# Altium schematic sheet MD040_Motor_Driver_RevE2.SchDoc
size 431 x 279 mm; Date: Not shown in title block; ApprovedBy: Not shown in title block; CheckedBy: Not shown in title block; Author: Not shown in title block; CompanyName: Not shown in title block; Engineer: Not shown in title block; Organization: Not shown in title block; Address1: Not shown in title block; Address2: Not shown in title block; Address3: Not shown in title block; Address4: Not shown in title block; DocumentNumber: 2; Revision: Use project parameter SCH_Rev; SheetNumber: 2; SheetTotal: 3; PageSetup: Record=PageOptions|CenterHorizontal=True|CenterVertical=True|PrintScale=1.00|XCorrection=1.00|YCorrection=1.00|PrintKind=0|BorderSize=5000000|LeftOffset=0|BottomOffset=0|Orientation=2|PaperLength=1000|PaperWidth=1000|Scale=100|PaperSource=15|PrintQuality=600|MediaType=1|DitherType=10|PaperKind=Letter|PrintScaleMode=1; CurrentTime: Not shown in title block; CurrentDate: Not shown in title block; Time: Not shown in title block; DocumentFullPathAndName: Not shown in title block; DocumentName: Not shown in title block; ModifiedDate: Not shown in title block; ImagePath: Not shown in title block
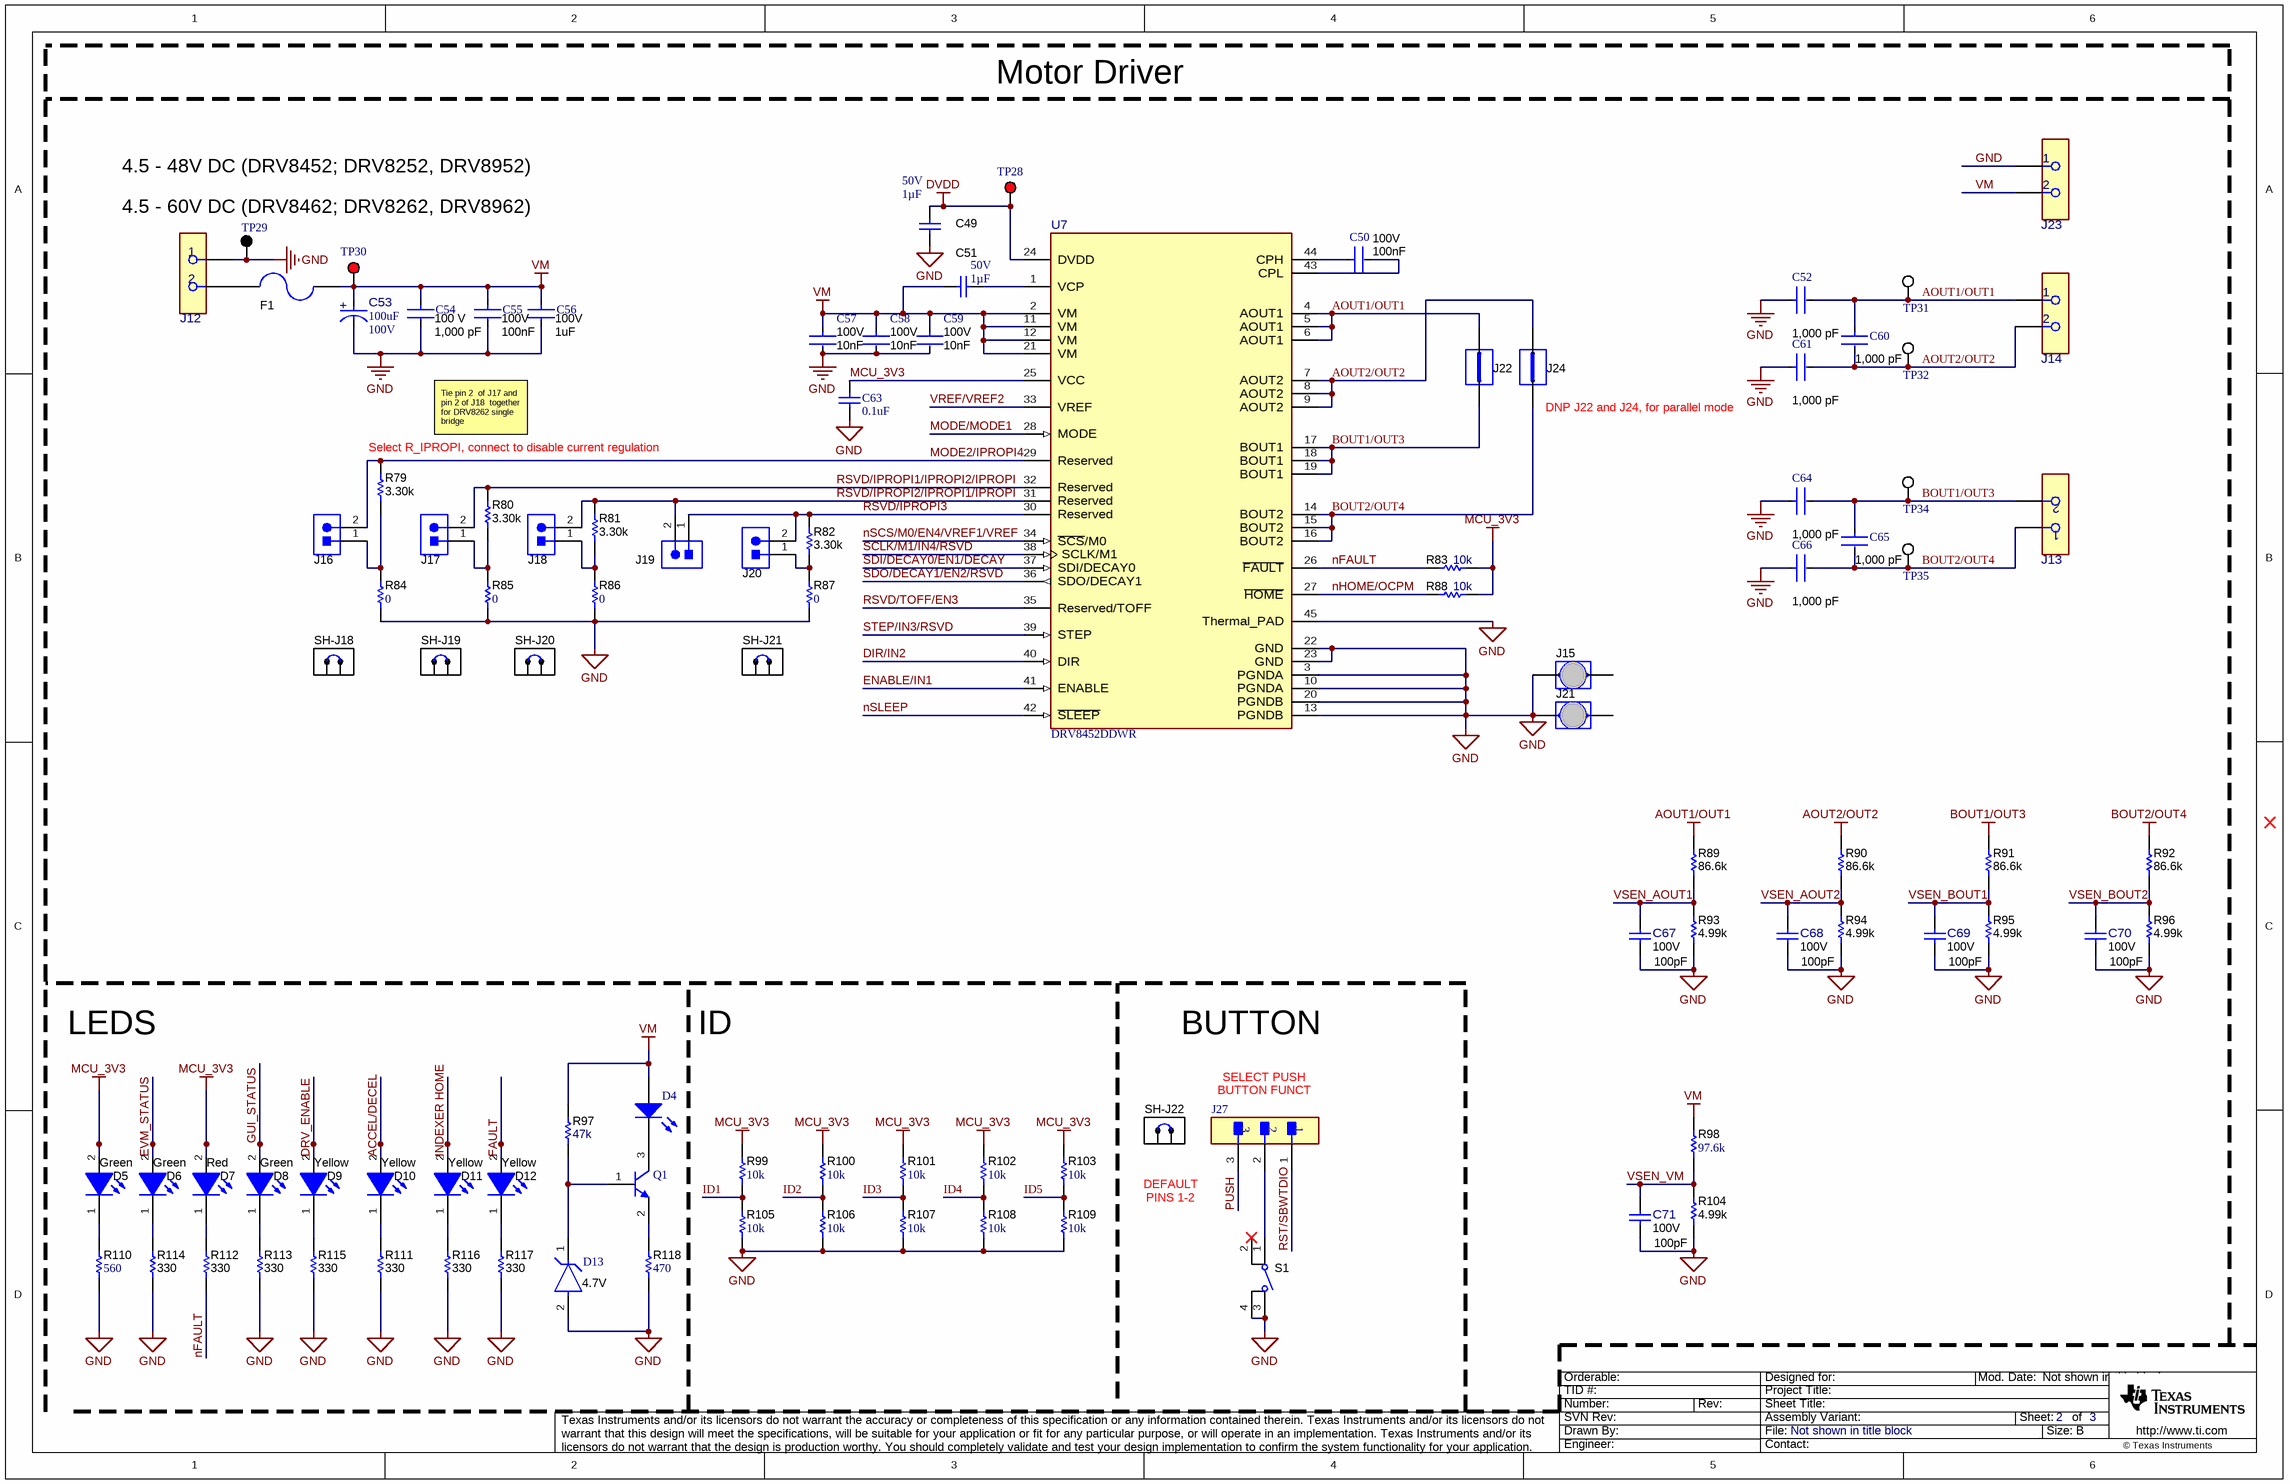
[diagram p0: MD040_Motor_Driver_RevE2.SchDoc]

## Parts
C49  Cap_F: 1µF  VDC_V: 50V  [0805_HV]  (hidden comment: C2012X7R1H105K125AB)
C50  Voltage Rating: 100V  Capacitance: 100nF  [FP-0603-L_1_6_0_1-W_0_8_0-IPC_B]  (hidden comment: HMK107BJ104MA-T)
C51  Cap_F: 1µF  VDC_V: 50V  [0805_HV]  (hidden comment: C2012X7R1H105K125AB)
C52  value 1,000 pF  [FP-C0603C-CF-MFG]  (hidden comment: C0603C102K1RACAUTO)
C53  ValueDisplayed: 100uF  VDC_V: 100V  [FP-EMVY101ARA101MKE0S_RADIAL-MFG]  (hidden comment: EMVY101ARA101MKE0S)
C54  value 1,000 pF  Voltage Rating: 100 V  [FP-C0603C-CF-MFG]  (hidden comment: C0603C102K1RACAUTO)
C55  Voltage Rating: 100V  Capacitance: 100nF  [FP-0603-L_1_6_0_1-W_0_8_0-IPC_B]  (hidden comment: HMK107BJ104MA-T)
C56  value 1uF  Voltage Rating: 100V  [FP-GRM21-0_2-MFG]  (hidden comment: GRM21BC72A105KE01L)
C57  Voltage Rating: 100V  Capacitance: 10nF  [FP-0603-L_1_6_0_1-W_0_8_0-IPC_A]  (hidden comment: HMK107B7103MA-T)
C58  Voltage Rating: 100V  Capacitance: 10nF  [FP-0603-L_1_6_0_1-W_0_8_0-IPC_A]  (hidden comment: HMK107B7103MA-T)
C59  Voltage Rating: 100V  Capacitance: 10nF  [FP-0603-L_1_6_0_1-W_0_8_0-IPC_A]  (hidden comment: HMK107B7103MA-T)
C60  value 1,000 pF  [FP-C0603C-CF-MFG]  (hidden comment: C0603C102K1RACAUTO)
C61  value 1,000 pF  [FP-C0603C-CF-MFG]  (hidden comment: C0603C102K1RACAUTO)
C63  0.1uF  [CAPC0603(1608)100_L]
C64  value 1,000 pF  [FP-C0603C-CF-MFG]  (hidden comment: C0603C102K1RACAUTO)
C65  value 1,000 pF  [FP-C0603C-CF-MFG]  (hidden comment: C0603C102K1RACAUTO)
C66  value 1,000 pF  [FP-C0603C-CF-MFG]  (hidden comment: C0603C102K1RACAUTO)
C67  VDC_V: 100V  Cap_F: 100pF  [FP-C0402C101J1HAC_0402-IPC_B]  (hidden comment: C0402C101J1HACTU)
C68  VDC_V: 100V  Cap_F: 100pF  [FP-C0402C101J1HAC_0402-IPC_B]  (hidden comment: C0402C101J1HACTU)
C69  VDC_V: 100V  Cap_F: 100pF  [FP-C0402C101J1HAC_0402-IPC_B]  (hidden comment: C0402C101J1HACTU)
C70  VDC_V: 100V  Cap_F: 100pF  [FP-C0402C101J1HAC_0402-IPC_B]  (hidden comment: C0402C101J1HACTU)
C71  VDC_V: 100V  Cap_F: 100pF  [FP-C0402C101J1HAC_0402-IPC_B]  (hidden comment: C0402C101J1HACTU)
D4  150060SS75000  [0603_A]  (value not drawn)
D5  value Green  [WL-SMCW_GREEN]  (hidden comment: 150060VS75000)
D6  value Green  [WL-SMCW_GREEN]  (hidden comment: 150060VS75000)
D7  value Red  [WL-SMCW_RED]  (hidden comment: 150060SS75000)
D8  value Green  [WL-SMCW_GREEN]  (hidden comment: 150060VS75000)
D9  value Yellow  [WL-SMCW_YELLOW]  (hidden comment: 150060YS75000)
D10  value Yellow  [WL-SMCW_YELLOW]  (hidden comment: 150060YS75000)
D11  value Yellow  [WL-SMCW_YELLOW]  (hidden comment: 150060YS75000)
D12  value Yellow  [WL-SMCW_YELLOW]  (hidden comment: 150060YS75000)
D13  Nom Zener Voltage: 4.7V  [FP-SOD323F-MFG]  (hidden comment: BZX84J-B4V7,115)
F1  0463015.ER  [Fuse_0463]  (value not drawn)
J12  691256610002  [FP-691256610002_HDR2-MFG]  (value not drawn)
J13  691250610002  [FP-691250610002_CONN_TERM_BLOCK2-MFG]  (value not drawn)
J14  691250610002  [FP-691250610002_CONN_TERM_BLOCK2-MFG]  (value not drawn)
J15  D3082-05  [Harwin_D3082-05]  (value not drawn)
J16  PBC02SAAN  [Sullins_PBC02SAAN]  (value not drawn)
J17  PBC02SAAN  [Sullins_PBC02SAAN]  (value not drawn)
J18  PBC02SAAN  [Sullins_PBC02SAAN]  (value not drawn)
J19  PBC02SAAN  [Sullins_PBC02SAAN]  (value not drawn)
J20  PBC02SAAN  [Sullins_PBC02SAAN]  (value not drawn)
J21  D3082-05  [Harwin_D3082-05]  (value not drawn)
J22  D3082-05  [Harwin_D3082-05]  (value not drawn)
J23  691250610002  [FP-691250610002_CONN_TERM_BLOCK2-MFG]  (value not drawn)
J24  D3082-05  [Harwin_D3082-05]  (value not drawn)
J27  PR20203VBNN  [FP-PR20203VBNN-MFG]  (value not drawn)
Q1  BC846BLT1G  [ONSC-SOT-23-3-318-08_V]  (value not drawn)
R79  ValueDisplayed: 3.30k  [0402L]  (hidden comment: ERJ-2RKF3301X)
R80  ValueDisplayed: 3.30k  [0402L]  (hidden comment: ERJ-2RKF3301X)
R81  ValueDisplayed: 3.30k  [0402L]  (hidden comment: ERJ-2RKF3301X)
R82  ValueDisplayed: 3.30k  [0402L]  (hidden comment: ERJ-2RKF3301X)
R83  ValueDisplayed: 10k  [0603L]  (hidden comment: RC0603JR-0710KL)
R84  ValueDisplayed: 0  [0402]  (hidden comment: CRCW04020000Z0EDHP)
R85  ValueDisplayed: 0  [0402]  (hidden comment: CRCW04020000Z0EDHP)
R86  ValueDisplayed: 0  [0402]  (hidden comment: CRCW04020000Z0EDHP)
R87  ValueDisplayed: 0  [0402]  (hidden comment: CRCW04020000Z0EDHP)
R88  ValueDisplayed: 10k  [0603L]  (hidden comment: RC0603JR-0710KL)
R89  ValueDisplayed: 86.6k  [0603L]  (hidden comment: CRCW060386K6FKEA)
R90  ValueDisplayed: 86.6k  [0603L]  (hidden comment: CRCW060386K6FKEA)
R91  ValueDisplayed: 86.6k  [0603L]  (hidden comment: CRCW060386K6FKEA)
R92  ValueDisplayed: 86.6k  [0603L]  (hidden comment: CRCW060386K6FKEA)
R93  ValueDisplayed: 4.99k  [0603L]  (hidden comment: CRCW06034K99FKEA)
R94  ValueDisplayed: 4.99k  [0603L]  (hidden comment: CRCW06034K99FKEA)
R95  ValueDisplayed: 4.99k  [0603L]  (hidden comment: CRCW06034K99FKEA)
R96  ValueDisplayed: 4.99k  [0603L]  (hidden comment: CRCW06034K99FKEA)
R97  ValueDisplayed: 47k  [0402]  (hidden comment: CRCW040247K0JNED)
R98  ValueDisplayed: 97.6k  [0603]  (hidden comment: RT0603DRE0797K6L)
R99  ValueDisplayed: 10k  [0603L]  (hidden comment: RC0603JR-0710KL)
R100  ValueDisplayed: 10k  [0603L]  (hidden comment: RC0603JR-0710KL)
R101  ValueDisplayed: 10k  [0603L]  (hidden comment: RC0603JR-0710KL)
R102  ValueDisplayed: 10k  [0603L]  (hidden comment: RC0603JR-0710KL)
R103  ValueDisplayed: 10k  [0603L]  (hidden comment: RC0603JR-0710KL)
R104  ValueDisplayed: 4.99k  [0603L]  (hidden comment: CRCW06034K99FKEA)
R105  ValueDisplayed: 10k  [0603L]  (hidden comment: RC0603JR-0710KL)
R106  ValueDisplayed: 10k  [0603L]  (hidden comment: RC0603JR-0710KL)
R107  ValueDisplayed: 10k  [0603L]  (hidden comment: RC0603JR-0710KL)
R108  ValueDisplayed: 10k  [0603L]  (hidden comment: RC0603JR-0710KL)
R109  ValueDisplayed: 10k  [0603L]  (hidden comment: RC0603JR-0710KL)
R110  ValueDisplayed: 560  [0603]  (hidden comment: RC0603FR-07560RL)
R111  ValueDisplayed: 330  [0603L]  (hidden comment: CMP-0025785-4)
R112  ValueDisplayed: 330  [0603L]  (hidden comment: CMP-0025785-4)
R113  ValueDisplayed: 330  [0603L]  (hidden comment: CMP-0025785-4)
R114  ValueDisplayed: 330  [0603L]  (hidden comment: CMP-0025785-4)
R115  ValueDisplayed: 330  [0603L]  (hidden comment: CMP-0025785-4)
R116  ValueDisplayed: 330  [0603L]  (hidden comment: CMP-0025785-4)
R117  ValueDisplayed: 330  [0603L]  (hidden comment: CMP-0025785-4)
R118  ValueDisplayed: 470  [0603]  (hidden comment: RC0603FR-07470RL)
S1  FSM4JSMA  [SW_FSM4JSMA]  (value not drawn)
SH-J18  SNT-100-BK-G  [SNT-100-BK-G]  (value not drawn)
SH-J19  SNT-100-BK-G  [SNT-100-BK-G]  (value not drawn)
SH-J20  SNT-100-BK-G  [SNT-100-BK-G]  (value not drawn)
SH-J21  SNT-100-BK-G  [SNT-100-BK-G]  (value not drawn)
SH-J22  SNT-100-BK-G  [SNT-100-BK-G]  (value not drawn)
TP28  5010  [Keystone5010]  (value not drawn)
TP29  5011  [Keystone5011]  (value not drawn)
TP30  5010  [Keystone5010]  (value not drawn)
TP31  5015  [Testpoint_Keystone_Miniature]  (value not drawn)
TP32  5015  [Testpoint_Keystone_Miniature]  (value not drawn)
TP34  5015  [Testpoint_Keystone_Miniature]  (value not drawn)
TP35  5015  [Testpoint_Keystone_Miniature]  (value not drawn)
U7  DRV8452DDWR  [DDW0044E-MFG]

## Nets
AOUT1/OUT1: C52.2 C60.1 J14.1 J22.2 R89.2 TP31.1 U7.4(AOUT1) U7.5(AOUT1) U7.6(AOUT1)
AOUT2/OUT2: C60.2 C61.2 J14.2 J24.2 R90.2 TP32.1 U7.7(AOUT2) U7.8(AOUT2) U7.9(AOUT2)
BOUT1/OUT3: C64.2 C65.1 J13.2 J22.1 R91.2 TP34.1 U7.17(BOUT1) U7.18(BOUT1) U7.19(BOUT1)
BOUT2/OUT4: C65.2 C66.2 J13.1 J24.1 R92.2 TP35.1 U7.14(BOUT2) U7.15(BOUT2) U7.16(BOUT2)
DVDD: C49.1 TP28.1 U7.24(DVDD)
GND: C49.2 C52.1 C53.1(CATHODE) C54.2 C55.2 C56.2 C57.2 C58.2 C59.2 C61.1 C63.1 C64.1 C66.1 C67.2 C68.2 C69.2 C70.2 C71.2 D13.2(A) J12.1 J15.1 J21.1 J23.1 R84.1 R85.1 R86.1 R87.1 R93.1 R94.1 R95.1 R96.1 R104.1 R105.2 R106.2 R107.2 R108.2 R109.2 R110.1 R111.1 R113.1 R114.1 R115.1 R116.1 R117.1 R118.1 S1.3 S1.4 TP29.1 U7.3(PGNDA) U7.10(PGNDA) U7.13(PGNDB) U7.20(PGNDB) U7.22(GND) U7.23(GND) U7.45(Thermal_PAD)
MCU_3V3: C63.2 D5.2(A) D7.2(A) R83.2 R88.2 R99.1 R100.1 R101.1 R102.1 R103.1 U7.25(VCC)
VM: C51.1 C53.2(ANODE) C54.1 C55.1 C56.1 C57.1 C58.1 C59.1 D4.2(A) F1.1 J23.2 R97.2 R98.2 TP30.1 U7.2(VM) U7.11(VM) U7.12(VM) U7.21(VM)
ACCEL/DECEL: D10.2(A)
DIR/IN2: U7.40(DIR)
DRV_ENABLE: D9.2(A)
ENABLE/IN1: U7.41(ENABLE)
EVM_STATUS: D6.2(A)
FAULT: D12.2(A)
GUI_STATUS: D8.2(A)
ID1: R99.2 R105.1
ID2: R100.2 R106.1
ID3: R101.2 R107.1
ID4: R102.2 R108.1
ID5: R103.2 R109.1
INDEXER HOME: D11.2(A)
MODE2/IPROPI4: J16.2 R79.2 U7.29(Reserved)
MODE/MODE1: U7.28(MODE)
nFAULT: R83.1 R112.1 U7.26(~{FAULT})
nHOME/OCPM: R88.1 U7.27(~{HOME})
nSCS/M0/EN4/VREF1/VREF: U7.34(~{SCS}/M0)
nSLEEP: U7.42(~{SLEEP})
PUSH: J27.3
RST/SBWTDIO: J27.1
RSVD/IPROPI1/IPROPI2/IPROPI: J17.2 R80.2 U7.32(Reserved)
RSVD/IPROPI2/IPROPI1/IPROPI: J18.2 J19.2 R81.2 U7.31(Reserved)
RSVD/IPROPI3: J19.1 J20.2 R82.2 U7.30(Reserved)
RSVD/TOFF/EN3: U7.35(Reserved/TOFF)
SCLK/M1/IN4/RSVD: U7.38(SCLK/M1)
SDI/DECAY0/EN1/DECAY: U7.37(SDI/DECAY0)
SDO/DECAY1/EN2/RSVD: U7.36(SDO/DECAY1)
STEP/IN3/RSVD: U7.39(STEP)
VREF/VREF2: U7.33(VREF)
VSEN_AOUT1: C67.1 R89.1 R93.2
VSEN_AOUT2: C68.1 R90.1 R94.2
VSEN_BOUT1: C69.1 R91.1 R95.2
VSEN_BOUT2: C70.1 R92.1 R96.2
VSEN_VM: C71.1 R98.1 R104.2
NetC50_1: C50.1 U7.44(CPH)
NetC50_2: C50.2 U7.43(CPL)
NetC51_2: C51.2 U7.1(VCP)
NetD4_1: D4.1(K) Q1.3(C)
NetD5_1: D5.1(K) R110.2
NetD6_1: D6.1(K) R114.2
NetD7_1: D7.1(K) R112.2
NetD8_1: D8.1(K) R113.2
NetD9_1: D9.1(K) R115.2
NetD10_1: D10.1(K) R111.2
NetD11_1: D11.1(K) R116.2
NetD12_1: D12.1(K) R117.2
NetD13_1: D13.1(C) Q1.1(B) R97.1
NetF1_2: F1.2 J12.2
NetJ16_1: J16.1 R79.1 R84.2
NetJ17_1: J17.1 R80.1 R85.2
NetJ18_1: J18.1 R81.1 R86.2
NetJ20_1: J20.1 R82.1 R87.2
NetJ27_2: J27.2 S1.1
NetQ1_2: Q1.2(E) R118.2

Not connected (* = marked no-connect by the designer): J15 2; J21 2; S1 2*

## Notes on the sheet
- Motor Driver
- 4.5 - 48V DC (DRV8452; DRV8252, DRV8952)
- 4.5 - 60V DC (DRV8462; DRV8262, DRV8962)
- Tie pin 2  of J17 and pin 2 of J18  together for DRV8262 single bridge
- (near J24) DNP J22 and J24, for parallel mode
- (near R79) Select R_IPROPI, connect to disable current regulation
- LEDS
- ID
- BUTTON
- SELECT PUSH
- BUTTON FUNCT
- DEFAULT
- PINS 1-2
- Drawn By:
- SVN Rev:
- Number:
- TID #:
- Orderable:
- Rev:
- Sheet Title:
- File:
- Project Title:
- Designed for:
- Assembly Variant:
- Mod. Date:
- Sheet:
- Size:
- of
- B
- http://www.ti.com
- Texas Instruments and/or its licensors do not warrant the accuracy or completeness of this specification or any information contained therein. Texas Instruments and/or its licensors do not warrant that this design will meet the specifications, will be suitable for your application or fit for any particular purpose, or will operate in an implementation. Texas Instruments and/or its licensors do not warrant that the design is production worthy. You should completely validate and test your design implementation to confirm the system functionality for your application.
- Engineer:
- Contact:
- © Texas Instruments
- (in symbol CMP-0094051-1) +

## Library data of the parts
C49 C51 = CMP-0007873-2: CAP, CERM, 1 uF, 50 V, +/- 10%, X7R, 0805; Manufacturer: TDK; TaMin_C: -55°C; ESR_ohm: 8.782m; Polarized: N; SizeAreaWB_mm2: 6.75; Value1: 0.008782 ohm; U/M: EA; Value: 1uF; TaMax_C: 125°C; SizeZ_mm: 1.45; SizeX_mm: 2; SizeY_mm: 1.25; Cap_Case: 0805; SizeArea_mm2: 2.5; IRMS_A: 2.2049A; AEC Category: Q200; Supplier Part Number 2: 810-C2012X7R1H105K; Publisher: Texas Instruments; Supplier 2: Mouser; TempCo: X7R; Published: 2008-06-19; RoHS: Y; MountType: SMT; Supplier 1: Digi-Key; PackageReference: 0805; Tolerance_%: 10%; Value2: 50V; CompType: Capacitor; LatestRevisionDate: 2017-03-09; PartNumber: C2012X7R1H105K125AB; AEC Qualified: N; ComponentLink1Description: Datasheet link; AEC Grade: N/A; Supplier Part Number 1: 445-7547-1-ND; Technology: Ceramic; ValueDisplayed: 1uF; ComponentLink1URL: https://product.tdk.com/en/search/capacitor/ceramic/mlcc/info?part_no=C2012X7R1H105K125AB
C50 C55 = CMP-14477-003474-1: Ceramic Capacitor General Use 0.1uF ±20% 100V X5R 0603; Mount: Surface Mount; Dielectric: X5R; Tolerance: 20%; Radiation Hardening: No; Max Operating Temperature: 85°C; RoHS Compliant: Yes; Depth: 0.8mm; Halogen Free: Halogen Free; Case/Package: Ceramic; Thickness: 0.035inch; Width: 0.031inch; Lead Free: Lead Free; Packaging: Tape and Reel; Min Operating Temperature: -55°C; Voltage Rating (DC): 100V; Length: 1.6mm
C52 C54 C60 C61 C64-C66 = CMP-2006-03016-2: CAP CER 1000PF 100V X7R 0603; Manufacturer: KEMET; Material: Ceramic; Automotive Grade: Grade 1; Temperature Coefficient: 30ppm/°C; Tolerance: 0.1; Category: Cap; ComponentLink2Description: Datasheet; Temperature: -55°C to +125°C; Height: 0.87mm; Octopart: https://octopart.com/c0603c102k1racauto-kemet-12573995; Package: C0603C-CF; Automotive: Yes; Digikey Description: CAP CER 1000PF 100V X7R 0603; Temperature Characteristic: X7R; Device Class L3: Ceramic Capacitors; Temperature Range High: +125°C; RoHS: TRUE; Capacitance: 1,000 pF; Device Class L1: Passive Components; Lead Free: Yes; Mouser Description: Multilayer Ceramic Capacitors MLCC - SMD/SMT 1000pF 100volts 10% X7R AUTO; Manufacturer Part Number: C0603C102K1RACAUTO; ComponentLink2URL: https://api.kemet.com/component-edge/download/datasheet/C0603C100J5GACAUTO.pdf; Temperature Range Low: -55°C; Device Class L2: Capacitors
  C52 C60 C61 C64-C66: Voltage Rating: 100 V
C53 = CMP-0094051-1: 100uF 100V 20% Aluminum Electrolytic Capacitors Radial, Can - SMD - 5000 Hrs @ 105°C; Manufacturer: United Chemi-Con; Value: 100µF; IRMS_A: 450mA; Life: 5000Hours; SizeZ_mm: 14mm; AEC Grade: Grade 2; Leakage Current: 100uA; Dissipation Factor: 10%; AEC Qualified: Yes; Tolerance_%: 20%; Supplier 1: Digikey; helpURL: https://upverter.com/upn/revision/452647827c621875/; Lead Free: Yes; Part Number: EMVY101ARA101MKE0S; Supplier Part Number 1: 565-2511-1-ND; PartNumber: EMVY101ARA101MKE0S; Cap_F: 100µF; ComponentLink1Description: Datasheet; Digikey Part Number: 565-2511-1-ND; Datasheet Path: datasheets/Cap-EMVY101ARA101MKE0S.pdf; RoHS: TRUE; Mouser Description: Cap Aluminum Lytic 100uF 100V 20% (12.5 X 13.5mm) SMD 450mA 5000h 105C Automotive T/R; ComponentLink1URL: https://www.chemi-con.co.jp/products/relatedfiles/capacitor/catalog/MVYRA-e.PDF; Operating Temperature Range: -40°C to +105°C; PackageReference: RADIAL; datasheet: https://www.chemi-con.co.jp/products/relatedfiles/capacitor/catalog/MVYRA-e.PDF; Digikey Description: CAP ALUM 100UF 20% 100V SMD; Mouser Part Number: 661-EMVY101ARA101MKE; Supplier Part Number 2: 661-EMVY101ARA101MKE; Supplier 2: Mouser
C56 = CMP-06035-000063-1: CAP CER 1UF 100V X7S 0805; Manufacturer: Murata; Tolerance: 10%; Material: Ceramic; Temperature Coefficient: 22%; Automotive: No; RoHS: TRUE; Temperature Range Low: -55°C; Device Class L2: Capacitors; Capacitance: 1uF; Device Class L1: Passive Components; Temperature: -55°C to +125°C; Manufacturer Part Number: GRM21BC72A105KE01L; Digikey Description: CAP CER 1UF 100V X7S 0805; ComponentLink2URL: https://search.murata.co.jp/Ceramy/image/img/A01X/G101/ENG/GRM21BC72A105KE01-01A.pdf; Octopart: https://octopart.com/grm21bc72a105ke01l-murata-71014565; Lead Free: Yes; Category: Cap; Height: 1.45mm; Device Class L3: Ceramic Capacitors; Package: GRM21-0.2; Ipc Land Pattern Name: CAPC200125X125; Temperature Characteristic: X7S; ComponentLink2Description: Datasheet; Temperature Range High: +125°C
C57-C59 = CMP-14477-001102-1: Ceramic Capacitor General Use 0.01uF ±20% 100V X7R 0603; Thickness: 0.035inch; RoHS Compliant: Yes; Max Operating Temperature: 125°C; Mount: Surface Mount; Tolerance: 20%; Width: 0.031inch; Packaging: Tape and Reel; Min Operating Temperature: -55°C; Length: 0.063inch; Case/Package: 0603
C63 = CMP-1035-02591-1: CAP 100nF 50V ±5% 0603 (1608 Metric) Thickness 1mm SMD; Tolerance: Â±5%; Case-Metric: 1608; Case-EIA: 0603; Rated Voltage: 50 V; Max Thickness: 1 mm; Technology: SMT; Value: 100nF
C67-C71 = CMP-0087080-2: CAP CER 100PF 100V X8R 0402; Manufacturer: Kemet; AEC Qualified: No; TempCo: 15%; SizeZ_mm: 0.55mm; Tolerance_%: 5%; AEC Grade: NA; Symbol Name: SYM-C0402C101J1HAC; ComponentLink1Description: Datasheet; ComponentLink1URL: https://content.kemet.com/datasheets/KEM_C1007_X8R_ULTRA_150C_SMD.pdf; PackageReference: 0402; RoHS: TRUE; PartNumber: C0402C101J1HACTU
D4 = CMP-1426-00004-1: SMD mono-color Chip LED, WL-SMCW, Super Red; Manufacturer: Wuerth Elektronik; PartNumber: 150060SS75000; ComponentLink2URL: http://katalog.we-online.com/led/datasheet/150060SS75000.pdf; ComponentLink2Description: Datasheet; PackageReference: 0603_A; ComponentLink1Description: Manufacturer URL; ComponentLink1URL: http://www.we-online.com; Color: Super Red
D5 D6 D8 = CMP-0002894-2: LED, Green, SMD; Manufacturer: Wurth Elektronik; Type: AlInGaP; Value2: 2V; Io_A: 20mA; Value1: W; ComponentLink1Description: Datasheet link; PackageReference: LED_0603; PartNumber: 150060VS75000; ComponentLink1URL: http://katalog.we-online.de/led/datasheet/150060VS75000.pdf; Color: green; RoHS: Y; MountType: SMT; CompType: LED; Vf_V: 2V
D7 = CMP-0002893-1: LED, Super Red, SMD; Manufacturer: Wurth Elektronik; Io_A: 20mA; Value1: W; U/M: EA; Vf_V: 1.9V; Type: AlInGaP; PartNumber: 150060SS75000; PackageReference: LED_0603; ComponentLink1Description: Datasheet link; ComponentLink1URL: http://katalog.we-online.de/led/datasheet/150060SS75000.pdf; Color: super red; Supplier Part Number 2: 95W3796; Publisher: Texas Instruments; Supplier 2: Newark; Supplier Part Number 3: 2322072; Supplier 3: Farnell; Published: 2008-07-11; RoHS: Y; MountType: SMT; Supplier 1: Digi-Key; Value2: 1.9V; CompType: LED; LatestRevisionDate: 2017-03-09; Supplier Part Number 1: 732-4979-1-ND
D9 = CMP-0002892-3: LED, Yellow, SMD; Manufacturer: Wurth Elektronik; Value1: W; Vf_V: 2V; Type: AlInGaP; Io_A: 20mA; PartNumber: 150060YS75000; PackageReference: LED_0603; ComponentLink1Description: Datasheet link; ComponentLink1URL: http://katalog.we-online.de/led/datasheet/150060YS75000.pdf; Color: yellow; MountType: SMT; Value2: 2V; CompType: LED; RoHS: Y
D10 D11 = CMP-0002892-3: LED, Yellow, SMD; Manufacturer: Wurth Elektronik; Type: AlInGaP; Value2: 2V; Io_A: 20mA; Value1: W; PartNumber: 150060YS75000; PackageReference: LED_0603; ComponentLink1Description: Datasheet link; ComponentLink1URL: http://katalog.we-online.de/led/datasheet/150060YS75000.pdf; Color: yellow; RoHS: Y; MountType: SMT; CompType: LED; Vf_V: 2V
D12 = CMP-0002892-3: LED, Yellow, SMD; Manufacturer: Wurth Elektronik; Io_A: 20mA; Value1: W; Vf_V: 2V; Type: AlInGaP; PartNumber: 150060YS75000; PackageReference: LED_0603; ComponentLink1Description: Datasheet link; ComponentLink1URL: http://katalog.we-online.de/led/datasheet/150060YS75000.pdf; Color: yellow; RoHS: Y; MountType: SMT; Value2: 2V; CompType: LED
D13 = CMP-14400-000003-1: DIODE ZENER 4.7V 550MW SOD323F; Manufacturer: Nexperia; Forward Current: 250mA; Max Junction Temp: +150°C; Max Reverse Leakage Current: 3uA; Automotive Grade: Grade 0; Zener Impedance: 80Ω; Max Zener Voltage: 4.79V; Reverse Voltage: 2V; Digikey Description: DIODE ZENER 4.7V 550MW SOD323F; Ambient Temperature Range Low: -55°C; ComponentLink2Description: Datasheet; Device Class L1: Discrete Semiconductors; Category: Diode; Ambient Temperature Range High: +150°C; Device Class L3: Zener Diodes; Power Dissipation: 550mW; Package: SOD323F; RoHS: TRUE; Lead Free: Yes; ComponentLink2URL: https://assets.nexperia.com/documents/data-sheet/BZX84J_SER.pdf; Octopart: https://octopart.com/bzx84j-b4v7%2C115-nexperia-78740280; Height: 0.8mm; Device Class L2: Diodes; Footprint Url: https://assets.nexperia.com/documents/outline-drawing/SOD323F.pdf; Manufacturer Part Number: BZX84J-B4V7,115; Automotive: Yes; Temperature: to +150°C; Temperature Range High: +150°C
F1 = CMP-0081016-1: Fuse, 15 A, 250 VAC, 100 VDC, SMD; Manufacturer: Littelfuse; TaMin_C: -55°C; Irating_A: 15A; SizeAreaWB_mm2: 61.952; Interrupt_AC: 100A; Interrupt_DC: 50A; VAC_V: 250V; TaMax_C: 125°C; Fuse Speed: Fast; SizeZ_mm: 3.12; SizeX_mm: 10.1; SizeArea_mm2: 31.512; VDC_V: 100V; Fuse Technology: Board Mount; Rtyp_Ohm: 4.7m; MeltingTyp: 142; ComponentLink1URL: http://www.littelfuse.com/~/media/electronics/datasheets/fuses/littelfuse_fuse_463_datasheet.pdf.pdf; RoHS: Y; MountType: SMT; PackageReference: 10.1x3.12mm; SizeY_mm: 3.12; CompType: Fuse; PartNumber: 0463015.ER; ComponentLink1Description: Datasheet URL
J12 = CMP-0086764-1: Manufacturer: Wurth; Current_A: 57A; Voltage_V: 750V; ContactFinish: Zinc; Row_Count: 1; PackageReference: HDR2; PinCount: 2; ComponentLink1Description: Datasheet; PartNumber: 691256610002; RoHS: TRUE; Symbol Name: SYM-691256610002; ComponentLink1URL: https://katalog.we-online.de/em/datasheet/691256610002.pdf
J13 J14 J23 = CMP-0093233-1: 2 Position Wire to Board Terminal Block Horizontal with Board 0.250" (6.35mm) Through Hole; Manufacturer: Wurth Electronics; Current_A: 32A; Conn Gender: Female; Row_Count: 1; ContactFinish: Zinc; SizeZ_mm: 21.6mm; Max Wire Gauge: 10; Min Wire Gauge: 30; Voltage_V: 450V; AEC Qualified: No; Is Female: yes; ComponentLink1Description: Datasheet; Supplier Part Number 1: 732-691250610002-ND; PartNumber: 691250610002; Mouser Part Number: 710-691250610002; Digikey Description: 6.35 MM TERMINAL BLOCK, HORIZONT; Conn Orientation: Horizontal; datasheet: https://www.we-online.com/catalog/datasheet/691250610002.pdf; Operating Temperature Range: -32°C to +120°C; Supplier 2: Mouser; Part Number: 691250610002; DUT-Pitch_mm: 6.35mm; helpURL: https://upverter.com/upn/revision/d28b3e63272a3f4f/; ComponentLink1URL: https://www.we-online.com/catalog/datasheet/691250610002.pdf; Supplier Part Number 2: 710-691250610002; Lead Free: Yes; Datasheet Path: datasheets/Conn-691250610002.pdf; Supplier 1: Digikey; RoHS: TRUE; PinCount: 2; PackageReference: CONN_TERM_BLOCK2; Digikey Part Number: 732-691250610002-ND
J15 J21 J22 J24 = CMP-0075110-1: 1mm Uninsulated Shorting Plug, 10.16mm spacing, TH; Manufacturer: Harwin; CNHeader: False; Green_Lifecycle: Active; Green_REACh: Passed; CompType: Jumper Wire; ComponentLink1URL: http://cdn.harwin.com/pdfs/D3080-D3083.pdf; Supplier Part Number 2: 01E9240; Publisher: Texas Instruments; Supplier 2: Newark; Supplier Part Number 3: 855-D3082-05; Supplier 3: Mouser; RoHS: Y; MountType: TH; Green_EU RoHS-2: Passed; Supplier 1: Digi-Key; Green_EU RoHS: Passed with Exemption; PackageReference: Shorting Plug, 10.16mm spacing, TH; LatestRevisionDate: 2017-07-12; PartNumber: D3082-05; ComponentLink1Description: Datasheet URL; Supplier Part Number 1: 952-1873-ND; CT: False
J16-J20 = CMP-0054566-1: Header, 100mil, 2x1, Gold, TH; Manufacturer: Sullins Connector Solutions; CNHeader: TRUE; Current_A: 3A; Green_Lifecycle: Active; Shrouded: N; Gender: Male; Green_REACh: Passed; Voltage_V: 1.8kV; Row_Count: 1; Pitch_mm: 2.54; CT: FALSE; Cert_UL: Y; ComponentLink1URL: http://www.sullinscorp.com/catalogs/77_PAGE108-109_.100_MALE_HDR.pdf; ClassName: Header; Publisher: Texas Instruments; Color: Black; RoHS: Y; MountType: TH; Green_EU RoHS-2: Passed; Supplier 1: Digi-Key; Green_EU RoHS: Passed; PackageReference: Sullins 100mil, 1x2, 230 mil above insulator; PinCount: 2; CompType: Header; LatestRevisionDate: 26/05/2017; PartNumber: PBC02SAAN; Orientation: Vertical; ComponentLink1Description: Datasheet URL; Supplier Part Number 1: S1011E-02-ND; ContactFinish: Gold
J27 = CMP-77940-000002-1: CONN HEADER VERT 3POS 2.54MM; Manufacturer: Metz Connect; Conn Orientation: Straight; Current Rating: 3A; Number Of Contacts: 3; Conn Gender: Male; Temperature: -40°C to +105°C; Pitch: 2.54mm; Device Class L1: Connectors; Digikey Description: CONN HEADER VERT 3POS 2.54MM; ComponentLink2URL: https://datasheet.octopart.com/PR20203VBNN-Metz-Connect-datasheet-101610322.pdf; Height: 8.6mm; Temperature Range High: +105°C; Manufacturer Part Number: PR20203VBNN; Number Of Rows: 1; Octopart: https://octopart.com/pr20203vbnn-metz+connect-87667116; Device Class L3: unset; ComponentLink2Description: Datasheet; Device Class L2: Headers and Wire Housings; Temperature Range Low: -40°C; Automotive: No; Contact Material: Gold,Nickel; Category: Conn; Lead Free: Yes; RoHS: TRUE; Package: PR20203VBNN
Q1 = CMP-1048-00779-1: General Purpose Transistor, NPN Silicon, 3-Pin SOT-23, Pb-Free, Tape and Reel; Manufacturer: On Semiconductor; fT Min (MHz): 100; IC Continuous (A): 0.1; Mounting Technology: Surface Mount; ComponentLink1Description: Manufacturer URL; ComponentLink2Description: Datasheet; Polarity: NPN; ComponentLink3URL: http://www.onsemi.cn/pub_link/Collateral/318-08.PDF; DatasheetVersion: Rev. 11; ComponentLink3Description: Package Specification; PartNumber: BC846BLT1G; RoHS: TRUE; PackageDescription: 3-Pin Small Outline Transistor, Body 2.92 x 1.3 mm, Pitch 0.95 mm; PackageReference: SOT-23-3-318-08; ComponentLink2URL: http://www.onsemi.cn/pub_link/Collateral/BC846ALT1-D.PDF; PackageVersion: Rev. AP, 11/2009; ComponentLink1URL: http://www.onsemi.com/; Packing: Tape and Reel
R79-R82 = CMP-0026695-1: RES, 3.30 k, 1%, 0.1 W, AEC-Q200 Grade 0, 0402; Manufacturer: Panasonic; Power_W: 100mW; TempCo: 100 ppm/C; Value_Code: 3k30; U/M: EA; Value: 3.30k; Res_ohm: 3.3k; SizeX_mm: 1; SizeY_mm: 0.5; SizeZ_mm: 0.6; Value2: 0.1W; AEC Qualified: Y; VDC_V: 50V; AEC Grade: 0; AEC Category: Q200; ComponentLink1URL: http://industrial.panasonic.com/cdbs/www-data/pdf/RDA0000/AOA0000C86.pdf; Supplier Part Number 2: 64R5278; Publisher: Texas Instruments; Supplier 2: Newark; Supplier Part Number 3: 667-ERJ-2RKF3301X; Supplier 3: Mouser; Published: 2008-06-26; RoHS: Y; Value1: 1%; MountType: SMT; Supplier 1: Digi-Key; PackageReference: 0402; Tolerance_%: 1%; SizeArea_mm2: 0.5; CompType: Resistor; LatestRevisionDate: 2017-03-09; PartNumber: ERJ-2RKF3301X; ComponentLink1Description: Datasheet link; Supplier Part Number 1: P3.30KLCT-ND; Technology: Thick Film
R83 R88 = CMP-0025886-3: RES, 10 k, 5%, 0.1 W, 0603; Manufacturer: Yageo America; Power_W: 100mW; TempCo: 100 ppm/C; Value_Code: 10k0; U/M: EA; Value: 10k; EIA_Code: E24; SizeX_mm: 1.6; SizeY_mm: 0.8; SizeZ_mm: 1; Value2: 0.1W; SizeArea_mm2: 1.28; VDC_V: 50V; AEC Category: Q200; Supplier Part Number 2: 603-RC0603JR-0710KL; Publisher: Texas Instruments; Supplier 2: Mouser; Supplier Part Number 3: 9233504; Supplier 3: Farnell; Published: 2008-06-26; RoHS: Y; Value1: 5%; MountType: SMT; Supplier 1: Digi-Key; PackageReference: 0603; Tolerance_%: 5%; Res_ohm: 10k; CompType: Resistor; LatestRevisionDate: 2017-03-09; PartNumber: RC0603JR-0710KL; AEC Qualified: ?; ComponentLink1Description: Datasheet link; Supplier Part Number 1: 311-10KGRCT-ND; Technology: Thick Film; ComponentLink1URL: http://www.yageo.com/pdf/Pu-RC0603_51_PbFree_L_2.pdf
R84-R87 = CMP-0081856-1: RES, 0, 0%, 0.2 W, AEC-Q200 Grade 0, 0402; Manufacturer: Vishay-Dale; SizeAreaWB_mm2: 3; SizeArea_mm2: 0.5; AEC Qualified: Y; AEC Category: Q200; Value: 0; SizeZ_mm: 0.6; Power_W: 200mW; VDC_V: 50V; Value2: 0.2W; SizeX_mm: 1; ComponentLink1Description: Datasheet link; RoHS: Y; Supplier Part Number 3: 71-CRCW04020000Z0EDH; Tolerance_%: 0%; Value_Code: 0; Supplier 1: Digi-Key; PackageReference: 0402; Technology: Thick Film; Res_ohm: 0; PartNumber: CRCW04020000Z0EDHP; Supplier Part Number 2: 96Y9050; Supplier 2: Newark; AEC Grade: 0; SizeY_mm: 0.5; ComponentLink1URL: http://www.vishay.com/docs/20043/crcwhpe3.pdf; Value1: 0%; CompType: Resistor; MountType: SMT; Supplier Part Number 1: 541-0.0YBTR-ND; Supplier 3: Mouser
R89-R92 = CMP-0022628-3: RES, 86.6 k, 1%, 0.1 W, 0603; Manufacturer: Vishay-Dale; Value: 86.6k; Value_Code: 86k6; Power_W: 100mW; Value2: 0.1W; VDC_V: 75V; TempCo: 100 ppm/C; EIA_Code: E96; U/M: EA; AEC Category: Q200; SizeY_mm: 0.8; SizeZ_mm: 1; SizeArea_mm2: 1.28; SizeX_mm: 1.6; CompType: Resistor; PartNumber: CRCW060386K6FKEA; PackageReference: 0603; RoHS: Y; Res_ohm: 86.6k; Tolerance_%: 1%; Value1: 1%; MountType: SMT; Technology: Thick Film; Published: 2008-06-26; Publisher: Texas Instruments; LatestRevisionDate: 2017-03-09; ComponentLink1Description: Datasheet link; ComponentLink1URL: http://www.vishay.com/docs/20035/dcrcwe3.pdf; Supplier 1: Digi-Key; Supplier Part Number 1: 541-86.6KHCT-ND; Supplier 2: Newark; Supplier Part Number 2: 52K8751; Supplier 3: Mouser; Supplier Part Number 3: 71-CRCW0603-86.6K-E3; AEC Qualified: ?
R93-R96 R104 = CMP-0022458-4: RES, 4.99 k, 1%, 0.1 W, AEC-Q200 Grade 0, 0603; Manufacturer: Vishay-Dale; Value: 4.99k; Value_Code: 4k99; Power_W: 100mW; Value2: 0.1W; VDC_V: 75V; TempCo: 100 ppm/C; EIA_Code: E96; SizeX_mm: 1.6; SizeY_mm: 0.8; SizeZ_mm: 1; SizeArea_mm2: 1.28; AEC Qualified: Y; AEC Category: Q200; AEC Grade: 0; CompType: Resistor; PartNumber: CRCW06034K99FKEA; PackageReference: 0603; RoHS: E; Res_ohm: 4.99k; Tolerance_%: 1%; Value1: 1%; MountType: SMT; Technology: Thick Film; ComponentLink1Description: Datasheet link; ComponentLink1URL: http://www.vishay.com/docs/20035/dcrcwe3.pdf; Supplier 1: Digi-Key; Supplier Part Number 1: 541-4.99KHCT-ND; Supplier 2: Newark; Supplier Part Number 2: 52K8500; Supplier 3: Mouser; Supplier Part Number 3: 71-CRCW0603-4.99K-E3
R97 = CMP-0026935-3: RES, 47 k, 5%, 0.063 W, AEC-Q200 Grade 0, 0402; Manufacturer: Vishay-Dale; Power_W: 63mW; TempCo: 200 ppm/C; Value_Code: 47k0; Value: 47k; EIA_Code: E24; SizeX_mm: 1; SizeY_mm: 0.5; SizeZ_mm: 0.6; Value2: 0.063W; AEC Qualified: Y; VDC_V: 50V; AEC Category: Q200; AEC Grade: 0; Supplier Part Number 2: 52K7099; Supplier 2: Newark; Supplier Part Number 3: 71-CRCW0402-J-47K-E3; Supplier 3: Mouser; RoHS: E; Value1: 5%; MountType: SMT; Supplier 1: Digi-Key; PackageReference: 0402; Tolerance_%: 5%; Res_ohm: 47k; SizeArea_mm2: 0.5; CompType: Resistor; PartNumber: CRCW040247K0JNED; ComponentLink1Description: Datasheet link; Supplier Part Number 1: 541-47KJCT-ND; Technology: Thick Film; ComponentLink1URL: http://www.vishay.com/docs/20035/dcrcwe3.pdf
R98 = CMP-0025663-3: RES, 97.6 k, 0.5%, 0.1 W, 0603; Manufacturer: Yageo America; Value: 97.6k; Value_Code: 97k6; Power_W: 100mW; Value2: 0.1W; VDC_V: 75V; TempCo: 50 ppm/C; EIA_Code: E192; U/M: EA; AEC Category: Q200; SizeY_mm: 0.8; SizeZ_mm: 1; SizeArea_mm2: 1.28; SizeX_mm: 1.6; CompType: Resistor; PartNumber: RT0603DRE0797K6L; PackageReference: 0603; RoHS: Y; Res_ohm: 97.6k; Tolerance_%: 0.5%; Value1: 0.5%; MountType: SMT; Technology: Thin Film; Published: 2008-06-26; Publisher: Texas Instruments; LatestRevisionDate: 2017-03-09; ComponentLink1Description: Datasheet link; ComponentLink1URL: http://www.yageo.com/pdf/PYu-RT_1-to-0.05_RoHS_L_3.pdf; AEC Qualified: ?
R99-R103 R105-R109 = CMP-0025886-5: RES, 10 k, 5%, 0.1 W, 0603; Manufacturer: Yageo; Power_W: 100mW; TempCo: 100 ppm/C; Value_Code: 10k0; Value: 10k; EIA_Code: E24; SizeX_mm: 1.6; SizeY_mm: 0.8; SizeZ_mm: 1; Value2: 0.1W; SizeArea_mm2: 1.28; AEC Qualified: N; VDC_V: 75V; AEC Category: Q200; SizeAreaWB_mm2: 4.68; Supplier Part Number 2: 603-RC0603JR-0710KL; Supplier 2: Mouser; Supplier Part Number 3: 9233504; Supplier 3: Farnell; RoHS: Y; Value1: 5%; MountType: SMT; Supplier 1: Digi-Key; PackageReference: 0603; Tolerance_%: 5%; Res_ohm: 10k; CompType: Resistor; PartNumber: RC0603JR-0710KL; ComponentLink1Description: Datasheet link; Supplier Part Number 1: 311-10KGRCT-ND; Technology: Thick Film; ComponentLink1URL: http://www.yageo.com/pdf/Pu-RC0603_51_PbFree_L_2.pdf; AEC Grade: N/A
R110 = CMP-0023183-5: RES, 560, 1%, 0.1 W, 0603; Manufacturer: Yageo; Power_W: 100mW; TempCo: 100 ppm/C; Value_Code: 560R; Value: 560; SizeX_mm: 1.6; SizeY_mm: 0.8; SizeZ_mm: 1; Value2: 0.1W; SizeArea_mm2: 1.28; AEC Qualified: N; VDC_V: 75V; AEC Category: Q200; SizeAreaWB_mm2: 4.68; Supplier Part Number 2: 603-RC0603FR-07560RL; Supplier 2: Mouser; Supplier Part Number 3: 9238450; Supplier 3: Farnell; RoHS: Y; Value1: 1%; MountType: SMT; Supplier 1: Digi-Key; PackageReference: 0603; Tolerance_%: 1%; Res_ohm: 560; CompType: Resistor; PartNumber: RC0603FR-07560RL; ComponentLink1Description: Datasheet link; Supplier Part Number 1: 311-560HRCT-ND; Technology: Thick Film; ComponentLink1URL: http://www.yageo.com/pdf/Pu-RC0603_51_PbFree_L_2.pdf; AEC Grade: N/A
R111-R117 = CMP-0025785-4: RES, 330, 5%, 0.1 W, AEC-Q200 Grade 0, 0603; PartNumber: CRCW0603330RJNEA; Manufacturer: Vishay-Dale; CompType: Resistor; Value: 330; Value_Code: 330R; Power_W: 100mW; Value2: 0.1W; VDC_V: 75V; TempCo: 200 ppm/C; EIA_Code: E24; AEC Category: Q200; AEC Qualified: Y; AEC Grade: 0; SizeX_mm: 1.6; SizeY_mm: 0.8; SizeZ_mm: 1; SizeArea_mm2: 1.28; PackageReference: 0603; RoHS: E; Res_ohm: 330; Tolerance_%: 5%; Value1: 5%; MountType: SMT; Technology: Thick Film; ComponentLink1Description: Datasheet link; ComponentLink1URL: http://www.vishay.com/docs/20035/dcrcwe3.pdf; Supplier 1: Digi-Key; Supplier Part Number 1: 541-330GCT-ND; Supplier 2: Newark; Supplier Part Number 2: 59M6805; Supplier 3: Mouser; Supplier Part Number 3: 71-CRCW0603J-330-E3
R118 = CMP-0023129-5: RES, 470, 1%, 0.1 W, 0603; Manufacturer: Yageo; Power_W: 100mW; TempCo: 100 ppm/C; Value_Code: 470R; Value: 470; SizeX_mm: 1.6; SizeY_mm: 0.8; SizeZ_mm: 1; Value2: 0.1W; SizeArea_mm2: 1.28; AEC Qualified: N; VDC_V: 75V; AEC Category: Q200; SizeAreaWB_mm2: 4.68; Supplier Part Number 2: 603-RC0603FR-07470RL; Supplier 2: Mouser; Supplier Part Number 3: 9238441; Supplier 3: Farnell; RoHS: Y; Value1: 1%; MountType: SMT; Supplier 1: Digi-Key; PackageReference: 0603; Tolerance_%: 1%; Res_ohm: 470; CompType: Resistor; PartNumber: RC0603FR-07470RL; ComponentLink1Description: Datasheet link; Supplier Part Number 1: 311-470HRCT-ND; Technology: Thick Film; ComponentLink1URL: http://www.yageo.com/pdf/Pu-RC0603_51_PbFree_L_2.pdf; AEC Grade: N/A
S1 = CMP-0002134-3: Switch, Tactile, SPST-NO, 0.05A, 12V, SMT; Manufacturer: TE Connectivity; CurrentRating_mA: 50A; PositionCount: 1; SwitchFunction: Off-Mom; Supplier 2: Newark; Supplier 3: Mouser; Supplier 1: Digi-Key; Supplier Part Number 1: 450-1129-ND; Supplier Part Number 2: 93K3887; Supplier Part Number 3: 506-FSM4JSMA; PartNumber: FSM4JSMA; ComponentLink1Description: Datasheet URL; CompType: Switch; Circuit: SPST-NO; VDC_V: 12V; RoHS: Y; Orientation: Top Actuated; PackageReference: SW, SPST 6x6 mm; MountType: SMT; ComponentLink1URL: http://www.te.com/commerce/DocumentDelivery/DDEController?Action=showdoc&DocId=Customer+Drawing%7F2-1437565-7%7FU2%7Fpdf%7FEnglish%7FENG_CD_2-1437565-7_U2.pdf%7F4-1437565-1
SH-J18-SH-J22 = CMP-0003623-1: Shunt, 100mil, Gold plated, Black; Alternate PartNumber: 969102-0000-DA; Manufacturer: Samtec; Alternate Manufacturer: 3M; Value: 1x2; ComponentLink1URL: http://www.samtec.com/ftppub/pdf/SNT.PDF; Key: SNT-100-BK-G; Publisher: Texas Instruments; Supplier 1: Digi-Key; CompType: Shunt; PackageReference: Shunt; LatestRevisionDate: 2017-03-09; ClassName: Shunt; RoHS: Y; Supplier Part Number 1: SNT-100-BK-G-ND; MountType: N/A; PartNumber: SNT-100-BK-G; ComponentLink1Description: Datasheet Link
TP28 TP30 = CMP-0055147-1: Test Point, Multipurpose, Red, TH; Manufacturer: Keystone; CNHeader: FALSE; Green_Lifecycle: Active; Green_REACh: Passed; ContactFinish: Silver; CT: TRUE; ComponentLink1URL: http://www.keyelco.com/userAssets/file/M60-2p60.pdf; Supplier Part Number 2: 534-5010; Publisher: Texas Instruments; Supplier 2: Mouser; Color: Red; RoHS: Y; MountType: TH; Green_EU RoHS-2: Incomplete; Supplier 1: Digi-Key; Green_EU RoHS: Passed; PackageReference: Red Multipurpose Testpoint; CompType: Test Point; LatestRevisionDate: 26/05/2017; PartNumber: 5010; ComponentLink1Description: Datasheet URL; Supplier Part Number 1: 36-5010-ND
TP29 = CMP-0055148-1: Test Point, Multipurpose, Black, TH; Manufacturer: Keystone; CNHeader: FALSE; Green_Lifecycle: Active; Green_REACh: Passed; ContactFinish: Silver; CT: TRUE; ComponentLink1URL: http://www.keyelco.com/userAssets/file/M60-2p60.pdf; Supplier Part Number 2: 534-5011; Publisher: Texas Instruments; Supplier 2: Mouser; Color: Black; RoHS: Y; MountType: TH; Green_EU RoHS-2: Incomplete; Supplier 1: Digi-Key; Green_EU RoHS: Passed; PackageReference: Black Multipurpose Testpoint; CompType: Test Point; LatestRevisionDate: 26/05/2017; PartNumber: 5011; ComponentLink1Description: Datasheet URL; Supplier Part Number 1: 36-5011-ND
TP31 TP32 TP34 TP35 = CMP-0055152-1: Test Point, Miniature, SMT; Manufacturer: Keystone; CNHeader: FALSE; Green_Lifecycle: Active; Green_REACh: Passed; CT: TRUE; ComponentLink1URL: http://www.keyelco.com/userAssets/store/files/5015.PDF; Supplier Part Number 2: 534-5015; Publisher: Texas Instruments; Supplier 2: Mouser; RoHS: Y; MountType: SMT; Green_EU RoHS-2: Incomplete; Supplier 1: Digi-Key; Green_EU RoHS: Passed; PackageReference: Testpoint_Keystone_Miniature; CompType: Test Point; LatestRevisionDate: 26/05/2017; PartNumber: 5015; ComponentLink1Description: Datasheet URL; Supplier Part Number 1: 36-5015TR-ND
U7 = CMP-0093481-2: Stepper Motor Driver with Automatic Microstepping, Silent step Decay Mode  and Auto-torque; Manufacturer: Texas Instruments; TJmax_C: +150°C; TaMin_C: -40°C; Standoff Height: 0.05mm; Number Of Outputs: 4; Nominal Supply Current: 3-7mA; AEC Qualified: No; Max Supply Voltage: 48V; AEC Category: Q200; Min Supply Voltage: 4.5V; TaMax_C: +125°C; Switching Frequency: 500kHz; CompType: IC; SizeZ_mm: 1.2mm; Motor Type: Stepper; ComponentLink1URL: http://www.ti.com/lit/ds/symlink/GPN.pdf; Datasheet Path: datasheets/IC-DRV8452DDWR.pdf; PackageReference: TSSOP44; ComponentLink2Description: Product Folder; ComponentLink3URL: http://www.ti.com/product/GPN/datasheet; RoHS: UNKNOWN; ComponentLink1Description: Datasheet Link; PartNumber: DRV8452DDWR; Part Number: DRV8452DDWR; ComponentLink3Description: Online Datasheet; helpURL: https://upverter.com/upn/revision/53fb04ac86e3d1d5/; ComponentLink2URL: http://www.ti.com/product/GPN; Operating Temperature Range: -40°C to +125°C